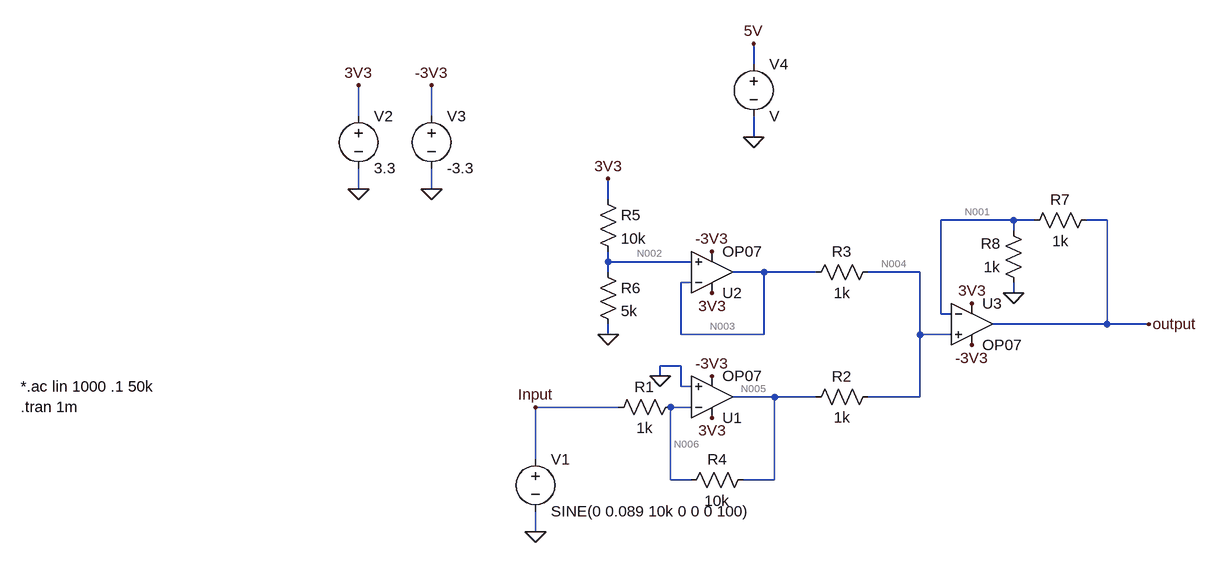
[diagram p0: schematic PT_redesign.asc]
PT_redesign.asc, the LTspice schematic file:
Version 4
SHEET 1 4084 2372
WIRE 800 1040 800 1008
WIRE 192 1120 192 1072
WIRE 304 1120 304 1072
WIRE 800 1152 800 1120
WIRE 192 1232 192 1200
WIRE 304 1232 304 1200
WIRE 576 1248 576 1216
WIRE 1200 1280 1088 1280
WIRE 1232 1280 1200 1280
WIRE 1344 1280 1312 1280
WIRE 1200 1296 1200 1280
WIRE 576 1344 576 1328
WIRE 704 1344 576 1344
WIRE 576 1360 576 1344
WIRE 816 1360 768 1360
WIRE 896 1360 816 1360
WIRE 1056 1360 976 1360
WIRE 704 1376 688 1376
WIRE 1200 1392 1200 1376
WIRE 1088 1424 1088 1280
WIRE 1104 1424 1088 1424
WIRE 1344 1440 1344 1280
WIRE 1344 1440 1168 1440
WIRE 1408 1440 1344 1440
WIRE 576 1456 576 1440
WIRE 688 1456 688 1376
WIRE 816 1456 816 1360
WIRE 816 1456 688 1456
WIRE 1056 1456 1056 1360
WIRE 1104 1456 1056 1456
WIRE 688 1504 656 1504
WIRE 656 1520 656 1504
WIRE 688 1536 688 1504
WIRE 704 1536 688 1536
WIRE 832 1552 768 1552
WIRE 896 1552 832 1552
WIRE 1056 1552 1056 1456
WIRE 1056 1552 976 1552
WIRE 592 1568 464 1568
WIRE 704 1568 672 1568
WIRE 464 1648 464 1568
WIRE 672 1680 672 1568
WIRE 704 1680 672 1680
WIRE 832 1680 832 1552
WIRE 832 1680 784 1680
WIRE 464 1760 464 1728
FLAG 656 1520 0
FLAG 576 1456 0
FLAG 1200 1392 0
FLAG 304 1232 0
FLAG 192 1232 0
FLAG 304 1072 -3V3
FLAG 192 1072 3V3
FLAG 576 1216 3V3
FLAG 736 1328 -3V3
FLAG 736 1392 3V3
FLAG 736 1584 3V3
FLAG 736 1520 -3V3
FLAG 1136 1472 -3V3
FLAG 1136 1408 3V3
FLAG 464 1760 0
FLAG 800 1152 0
FLAG 800 1008 5V
FLAG 464 1568 Input
FLAG 1408 1440 output
SYMBOL OpAmps/OP07 736 1424 M180
SYMATTR InstName U2
SYMBOL OpAmps/OP07 1136 1376 R0
SYMATTR InstName U3
SYMBOL voltage 464 1632 R0
SYMATTR InstName V1
SYMATTR Value SINE(0 0.089 10k 0 0 0 100)
SYMATTR Value2 AC 0.089
SYMBOL Res 688 1552 R90
WINDOW 0 0 56 VBottom 2
WINDOW 3 32 56 VTop 2
SYMATTR InstName R1
SYMATTR Value 1k
SYMBOL OpAmps/OP07 736 1616 M180
SYMATTR InstName U1
SYMBOL Res 800 1664 R90
WINDOW 0 0 56 VBottom 2
WINDOW 3 32 56 VTop 2
SYMATTR InstName R4
SYMATTR Value 10k
SYMBOL Res 992 1536 R90
WINDOW 0 0 56 VBottom 2
WINDOW 3 32 56 VTop 2
SYMATTR InstName R2
SYMATTR Value 1k
SYMBOL Res 992 1344 R90
WINDOW 0 0 56 VBottom 2
WINDOW 3 32 56 VTop 2
SYMATTR InstName R3
SYMATTR Value 1k
SYMBOL Res 560 1232 R0
SYMATTR InstName R5
SYMATTR Value 10k
SYMBOL Res 560 1344 R0
SYMATTR InstName R6
SYMATTR Value 5k
SYMBOL Res 1328 1264 R90
WINDOW 0 0 56 VBottom 2
WINDOW 3 32 56 VTop 2
SYMATTR InstName R7
SYMATTR Value 1k
SYMBOL Res 1216 1392 R180
WINDOW 0 36 76 Left 2
WINDOW 3 36 40 Left 2
SYMATTR InstName R8
SYMATTR Value 1k
SYMBOL Voltage 192 1104 R0
SYMATTR InstName V2
SYMATTR Value 3.3
SYMBOL Voltage 304 1104 R0
SYMATTR InstName V3
SYMATTR Value -3.3
SYMBOL voltage 800 1024 R0
SYMATTR InstName V4
TEXT -328 1536 Left 2 !*.ac lin 1000 .1 50k\n.tran 1m

The netlist it stands for:
* PT_redesign.asc
XU2 N002 N003 3V3 -3V3 N003 LT1001  ; OP07, pins In+ In- V+ V- OUT
XU3 N004 N001 3V3 -3V3 output LT1001  ; OP07, pins In+ In- V+ V- OUT
V1 Input 0 SINE(0 0.089 10k 0 0 0 100) AC 0.089
R1 N006 Input 1k
XU1 0 N006 3V3 -3V3 N005 LT1001  ; OP07, pins In+ In- V+ V- OUT
R4 N005 N006 10k
R2 N004 N005 1k
R3 N004 N003 1k
R5 3V3 N002 10k
R6 N002 0 5k
R7 output N001 1k
R8 0 N001 1k
V2 3V3 0 3.3
V3 -3V3 0 -3.3
V4 5V 0 V
*.ac lin 1000 .1 50k
.tran 1m
.lib LTC.lib
.backanno
.end

* Results of the author's LTspice run, read from the files saved beside the schematic
* Operating Point, zero values left out:
*   V(n003) = 1.1 V
*   V(n002) = 1.1 V
*   V(3v3) = 3.3 V
*   V(-3v3) = -3.3 V
*   V(n001) = 550 mV
*   V(n004) = 550 mV
*   V(output) = 1.1 V
*   V(n006) = 24.69 nV
*   V(n005) = 271.6 nV
*   I(R1) = 24.69 pA
*   I(R4) = 24.69 pA
*   I(R2) = 550 µA
*   I(R3) = -550 µA
*   I(R5) = 220 µA
*   I(R6) = 220 µA
*   I(R7) = 550 µA
*   I(R8) = -550 µA
*   I(V1) = 24.69 pA
*   I(V2) = -7.27 mA
*   I(V3) = 6.5 mA
*   Ix(u2:1) = 1.985 pA
*   Ix(u2:2) = 1.944 pA
*   Ix(u2:3) = 2.533 mA
*   Ix(u2:4) = -1.983 mA
*   Ix(u2:5) = -550 µA
*   Ix(u3:1) = 1.002 pA
*   Ix(u3:3) = 2.533 mA
*   Ix(u3:4) = -1.983 mA
*   Ix(u3:5) = -550 µA
*   Ix(u1:3) = 1.983 mA
*   Ix(u1:4) = -2.533 mA
*   Ix(u1:5) = 550 µA
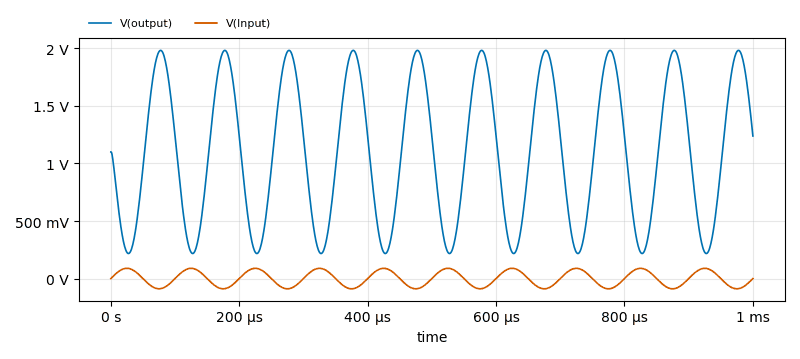
[diagram p1: Transient Analysis of PT_redesign.asc, plotted from the saved traces]
* Transient Analysis, 1 run:
*   V(output): min 217.4 mV, max 1.982 V, average 1.1 V, rms 1.265 V, last 1.238 V
*   V(Input): min -89 mV, max 89 mV, average -2.195 µV, rms 62.97 mV, last 0 V